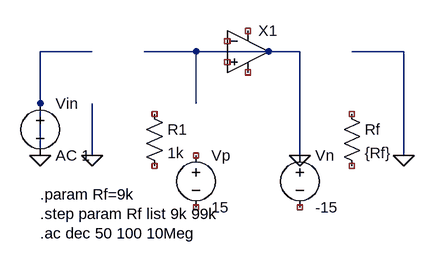
[diagram p0: schematic Ex11.asc]
Ex11.asc, the LTspice schematic file:
Version 4
SHEET 1 1920 1080
WIRE 160 160 80 160
WIRE 320 160 240 160
WIRE 480 160 320 160
WIRE 640 160 560 160
WIRE 480 240 480 160
WIRE 320 240 320 160
WIRE 160 320 160 240
WIRE 480 320 480 240
WIRE 80 320 80 160
WIRE 640 320 640 160
FLAG 80 320 0
FLAG 160 320 0
FLAG 480 320 0
FLAG 640 320 0
SYMBOL voltage 80 224 R0
WINDOW 123 24 44 Left 2
WINDOW 39 0 0 Left 0
SYMATTR InstName Vin
SYMATTR Value AC 1
SYMBOL res 240 240 R0
SYMATTR InstName R1
SYMATTR Value 1k
SYMBOL res 544 240 R0
SYMATTR InstName Rf
SYMATTR Value {Rf}
SYMBOL Opamps\UniversalOpAmp2 400 160 R0
SYMATTR InstName X1
SYMBOL voltage 320 304 R0
WINDOW 123 0 0 Left 0
WINDOW 39 0 0 Left 0
SYMATTR InstName Vp
SYMATTR Value 15
SYMBOL voltage 480 304 R0
WINDOW 123 0 0 Left 0
WINDOW 39 0 0 Left 0
SYMATTR InstName Vn
SYMATTR Value -15
NET 160 160 inp
NET 320 160 inn
NET 640 160 out
TEXT 80 380 Left 2 !.param Rf=9k
TEXT 80 410 Left 2 !.step param Rf list 9k 99k
TEXT 80 440 Left 2 !.ac dec 50 100 10Meg

The netlist it stands for:
* Ex11.asc
Vin 0 0 AC 1
R1 NC_01 NC_02 1k
Rf NC_03 NC_04 {Rf}
XX1 NC_05 NC_06 NC_07 NC_08 0 level2 Avol=1Meg GBW=10Meg Slew=10Meg Ilimit=25m Rail=0 Vos=0 En=0 Enk=0 In=0 Ink=0 Rin=500Meg  ; pins In+ In- V+ V- OUT
Vp NC_09 NC_10 15
Vn 0 NC_11 -15
.param Rf=9k
.step param Rf list 9k 99k
.ac dec 50 100 10Meg
.lib UniversalOpAmp2.lib
.backanno
.end